# Altium schematic sheet unannotated.SchDoc
size 254 x 203 mm
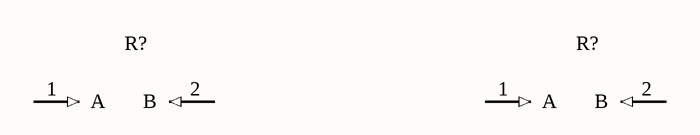
[diagram p0: unannotated.SchDoc]

## Parts
(Parts that share a designator on the sheet are numbered #1, #2 ... from top to bottom, then left to right.)
R?#1  (no value)
R?#2  (no value)

## Nets

Not connected (* = marked no-connect by the designer): R?#1 1(A) 2(B); R?#2 1(A) 2(B)

## Library data of the parts
R?#1 R?#2 = Resistor